# Altium schematic sheet Top-Sheet.SchDoc
size A4; SheetNumber: 1; SheetTotal: 7
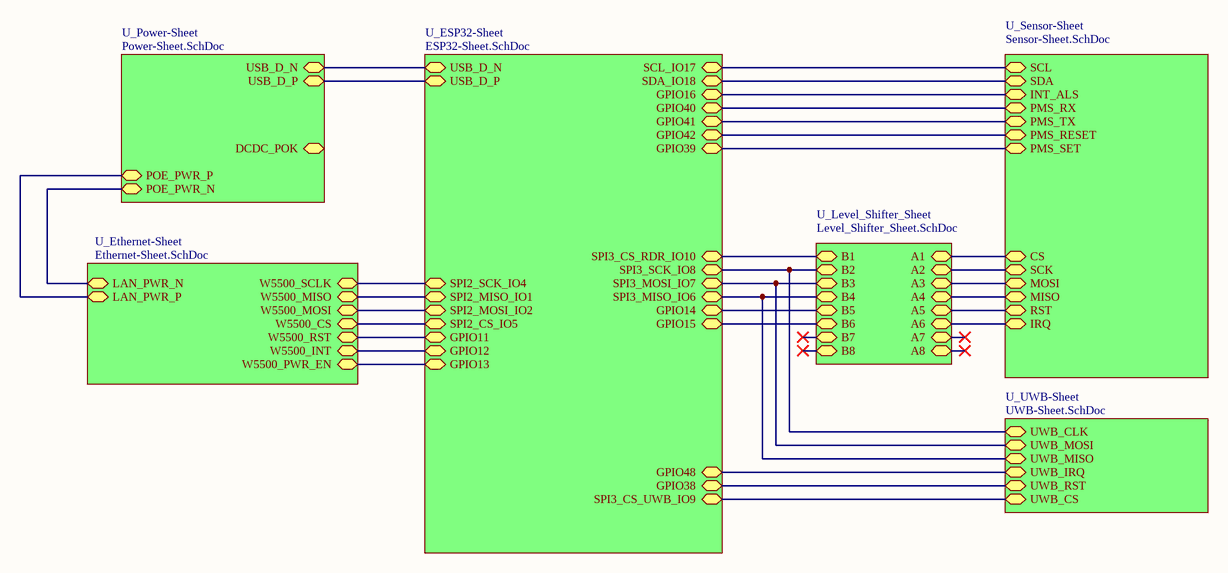
[diagram p0: Top-Sheet.SchDoc]

## Sub-sheets
U_ESP32-Sheet = ESP32-Sheet.SchDoc: SPI2_MISO_IO1 (bidir), SPI2_MOSI_IO2 (bidir), SPI2_SCK_IO4 (bidir), SPI2_CS_IO5 (bidir), GPIO11 (bidir), GPIO12 (bidir), GPIO13 (bidir), GPIO16 (bidir), SCL_IO17 (bidir), SDA_IO18 (bidir), GPIO39 (bidir), GPIO40 (bidir), GPIO41 (bidir), GPIO42 (bidir), SPI3_CS_RDR_IO10 (bidir), SPI3_SCK_IO8 (bidir), SPI3_MOSI_IO7 (bidir), SPI3_MISO_IO6 (bidir), GPIO14 (bidir), GPIO15 (bidir), GPIO48 (bidir), GPIO38 (bidir), SPI3_CS_UWB_IO9 (bidir), USB_D_P (bidir), USB_D_N (bidir)
U_Ethernet-Sheet = Ethernet-Sheet.SchDoc: W5500_SCLK (bidir), W5500_MISO (bidir), W5500_MOSI (bidir), W5500_RST (bidir), W5500_INT (bidir), W5500_CS (bidir), W5500_PWR_EN (bidir), LAN_PWR_N (bidir), LAN_PWR_P (bidir)
U_Level_Shifter_Sheet = Level_Shifter_Sheet.SchDoc: A1 (bidir), A2 (bidir), A3 (bidir), A4 (bidir), A5 (bidir), A6 (bidir), A7 (bidir), A8 (bidir), B1 (bidir), B2 (bidir), B3 (bidir), B4 (bidir), B5 (bidir), B6 (bidir), B7 (bidir), B8 (bidir)
U_Power-Sheet = Power-Sheet.SchDoc: POE_PWR_P (bidir), POE_PWR_N (bidir), USB_D_P (bidir), USB_D_N (bidir), DCDC_POK (bidir)
U_Sensor-Sheet = Sensor-Sheet.SchDoc: CS (bidir), INT_ALS (bidir), IRQ (bidir), MISO (bidir), MOSI (bidir), PMS_RESET (bidir), PMS_RX (bidir), PMS_SET (bidir), PMS_TX (bidir), RST (bidir), SCK (bidir), SCL (bidir), SDA (bidir)
U_UWB-Sheet = UWB-Sheet.SchDoc: UWB_RST (bidir), UWB_CLK (bidir), UWB_MISO (bidir), UWB_MOSI (bidir), UWB_CS (bidir), UWB_IRQ (bidir)

## Nets
(unnamed): sheet U_Power-Sheet/POE_PWR_P, sheet U_Ethernet-Sheet/LAN_PWR_P
(unnamed): sheet U_Power-Sheet/POE_PWR_N, sheet U_Ethernet-Sheet/LAN_PWR_N
(unnamed): sheet U_Power-Sheet/USB_D_P, sheet U_ESP32-Sheet/USB_D_P
(unnamed): sheet U_Power-Sheet/USB_D_N, sheet U_ESP32-Sheet/USB_D_N
(unnamed): sheet U_Sensor-Sheet/CS, sheet U_Level_Shifter_Sheet/A1
(unnamed): sheet U_Sensor-Sheet/INT_ALS, sheet U_ESP32-Sheet/GPIO16
(unnamed): sheet U_Sensor-Sheet/IRQ, sheet U_Level_Shifter_Sheet/A6
(unnamed): sheet U_Sensor-Sheet/MISO, sheet U_Level_Shifter_Sheet/A4
(unnamed): sheet U_Sensor-Sheet/MOSI, sheet U_Level_Shifter_Sheet/A3
(unnamed): sheet U_Sensor-Sheet/PMS_RESET, sheet U_ESP32-Sheet/GPIO42
(unnamed): sheet U_Sensor-Sheet/PMS_RX, sheet U_ESP32-Sheet/GPIO40
(unnamed): sheet U_Sensor-Sheet/PMS_SET, sheet U_ESP32-Sheet/GPIO39
(unnamed): sheet U_Sensor-Sheet/PMS_TX, sheet U_ESP32-Sheet/GPIO41
(unnamed): sheet U_Sensor-Sheet/RST, sheet U_Level_Shifter_Sheet/A5
(unnamed): sheet U_Sensor-Sheet/SCK, sheet U_Level_Shifter_Sheet/A2
(unnamed): sheet U_Sensor-Sheet/SCL, sheet U_ESP32-Sheet/SCL_IO17
(unnamed): sheet U_Sensor-Sheet/SDA, sheet U_ESP32-Sheet/SDA_IO18
(unnamed): sheet U_Ethernet-Sheet/W5500_SCLK, sheet U_ESP32-Sheet/SPI2_SCK_IO4
(unnamed): sheet U_Ethernet-Sheet/W5500_MISO, sheet U_ESP32-Sheet/SPI2_MISO_IO1
(unnamed): sheet U_Ethernet-Sheet/W5500_MOSI, sheet U_ESP32-Sheet/SPI2_MOSI_IO2
(unnamed): sheet U_Ethernet-Sheet/W5500_RST, sheet U_ESP32-Sheet/GPIO11
(unnamed): sheet U_Ethernet-Sheet/W5500_INT, sheet U_ESP32-Sheet/GPIO12
(unnamed): sheet U_Ethernet-Sheet/W5500_CS, sheet U_ESP32-Sheet/SPI2_CS_IO5
(unnamed): sheet U_Ethernet-Sheet/W5500_PWR_EN, sheet U_ESP32-Sheet/GPIO13
(unnamed): sheet U_Level_Shifter_Sheet/B1, sheet U_ESP32-Sheet/SPI3_CS_RDR_IO10
(unnamed): sheet U_Level_Shifter_Sheet/B2, sheet U_ESP32-Sheet/SPI3_SCK_IO8, sheet U_UWB-Sheet/UWB_CLK
(unnamed): sheet U_Level_Shifter_Sheet/B3, sheet U_ESP32-Sheet/SPI3_MOSI_IO7, sheet U_UWB-Sheet/UWB_MOSI
(unnamed): sheet U_Level_Shifter_Sheet/B4, sheet U_ESP32-Sheet/SPI3_MISO_IO6, sheet U_UWB-Sheet/UWB_MISO
(unnamed): sheet U_Level_Shifter_Sheet/B5, sheet U_ESP32-Sheet/GPIO14
(unnamed): sheet U_Level_Shifter_Sheet/B6, sheet U_ESP32-Sheet/GPIO15
(unnamed): sheet U_ESP32-Sheet/GPIO48, sheet U_UWB-Sheet/UWB_IRQ
(unnamed): sheet U_ESP32-Sheet/GPIO38, sheet U_UWB-Sheet/UWB_RST
(unnamed): sheet U_ESP32-Sheet/SPI3_CS_UWB_IO9, sheet U_UWB-Sheet/UWB_CS

## Notes on the sheet
- File:
- Title:
- Date:
- Page
- Num:
- Total:
- Drawn By: Huzaifa Ali